# Altium schematic sheet SDR_Power.SchDoc
size B; SheetNumber: 4; SheetTotal: 4
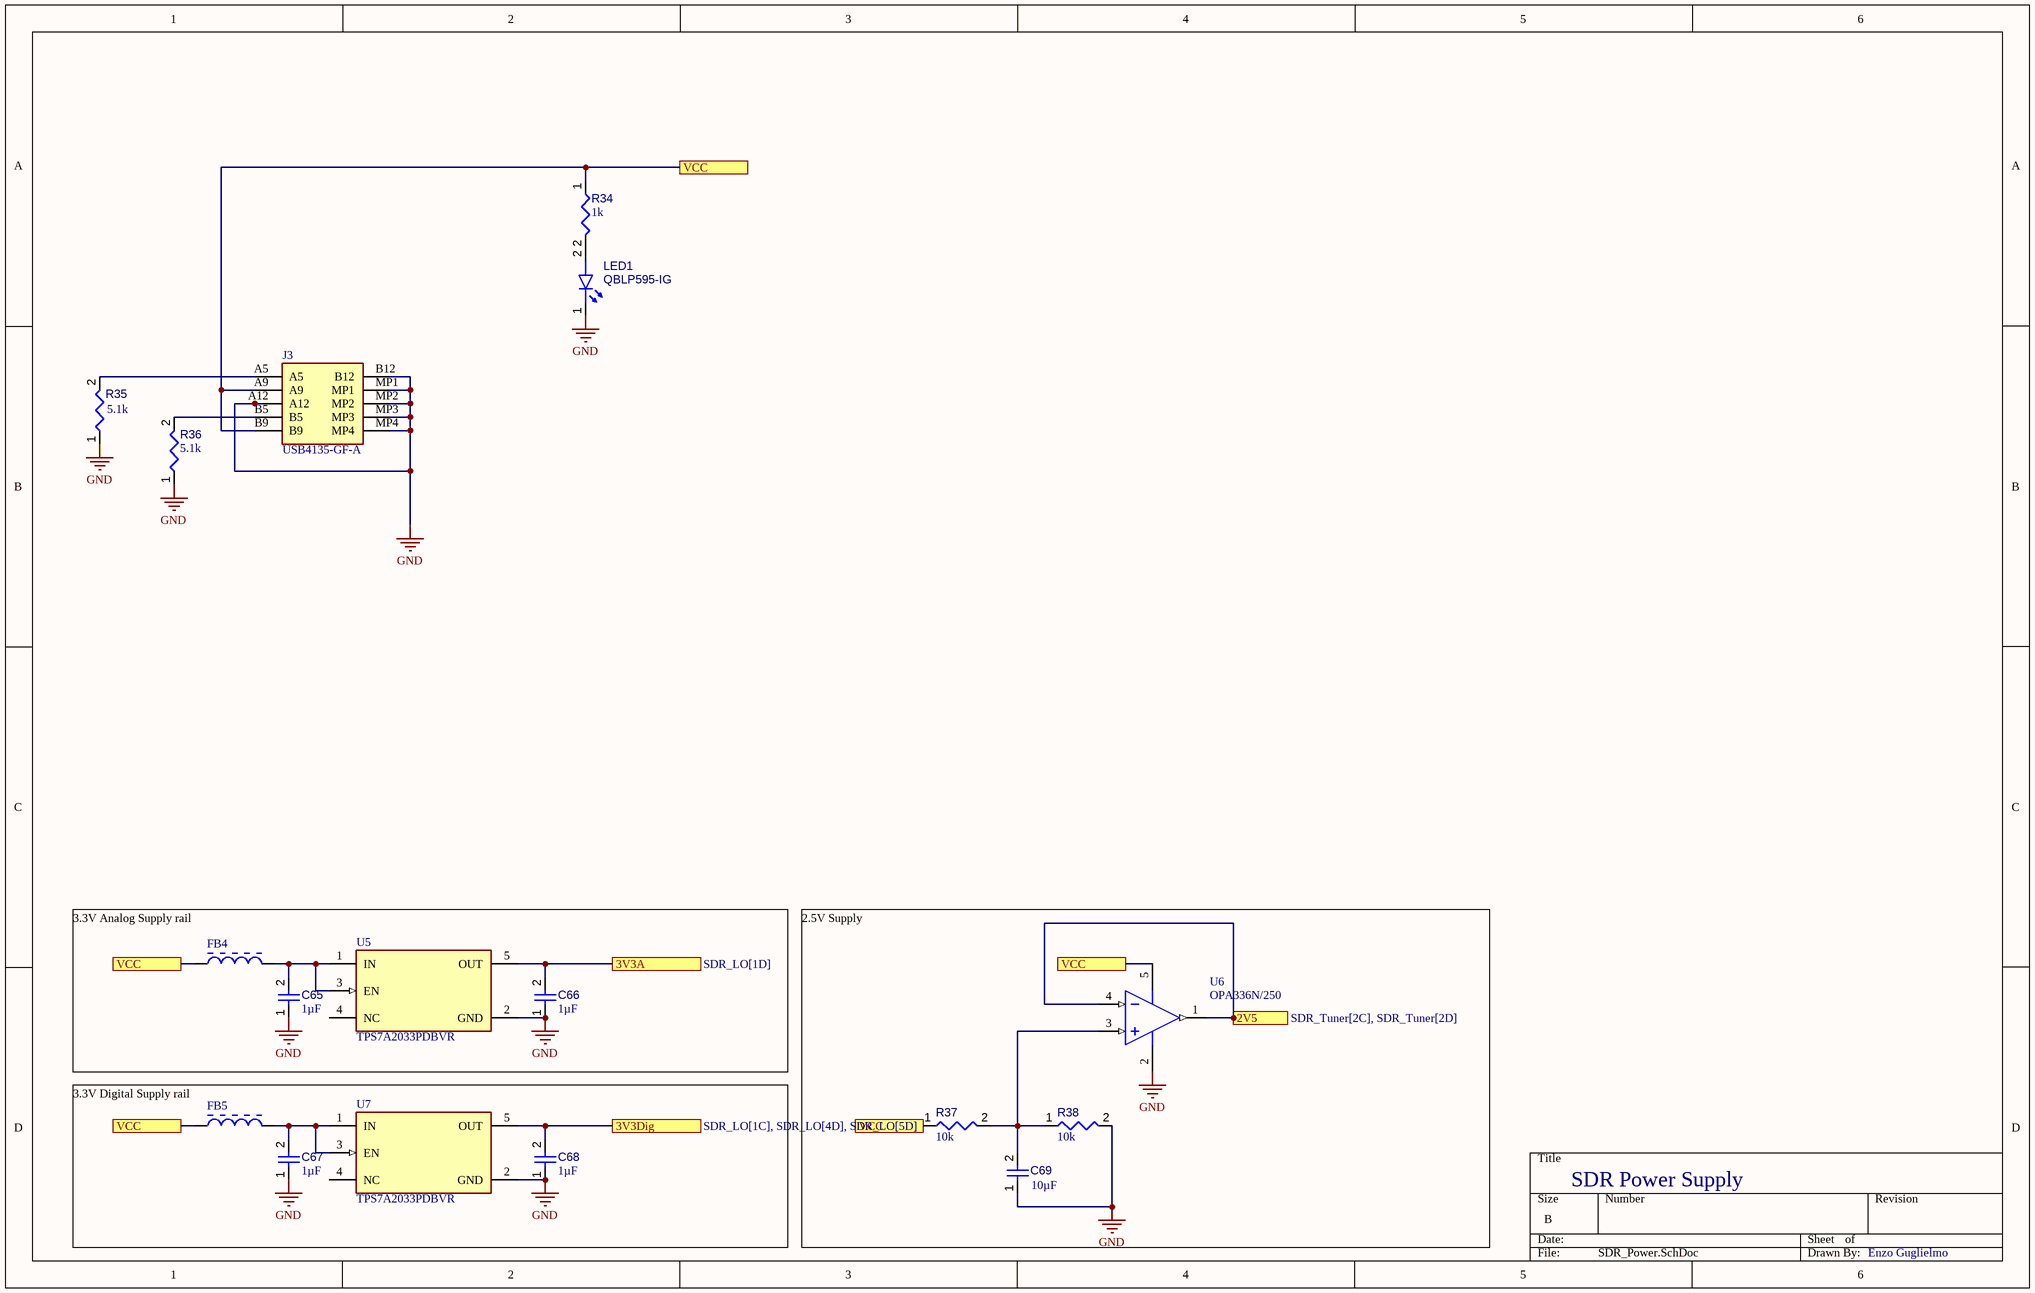
[diagram p0: SDR_Power.SchDoc]

## Parts
C65  value 1µF  [CAPC0402(1005)60_L]  (hidden comment: Capacitor 1µF +/-20% 10V 0402)
C66  value 1µF  [CAPC0402(1005)60_L]  (hidden comment: Capacitor 1µF +/-20% 10V 0402)
C67  value 1µF  [CAPC0402(1005)60_L]  (hidden comment: Capacitor 1µF +/-20% 10V 0402)
C68  value 1µF  [CAPC0402(1005)60_L]  (hidden comment: Capacitor 1µF +/-20% 10V 0402)
C69  value 10µF  [CAPC0402(1005)60_L]  (hidden comment: Capacitor 10µF +/-40% 6.3V 0402)
FB4  BLM21PG331SN1D  [INDC2013X105X50ML20T20]  (value not drawn)
FB5  BLM21PG331SN1D  [INDC2013X105X50ML20T20]  (value not drawn)
J3  USB4135-GF-A  [USB4135GFA]
LED1  QBLP595-IG  [QTB-QBLP595_V]
R34  value 1k  [RESC1005X40X25ML05T05]  (hidden comment: Resistor 100k +/-1% 0402 63 mW)
R35  value 5.1k  [RESC1005X40X25ML05T05]  (hidden comment: Resistor 100k +/-1% 0402 63 mW)
R36  value 5.1k  [RESC1005X40X25ML05T05]  (hidden comment: Resistor 100k +/-1% 0402 63 mW)
R37  value 10k  [RESC0402(1005)_L]  (hidden comment: 10KR2F)
R38  value 10k  [RESC0402(1005)_L]  (hidden comment: 10KR2F)
U5  TPS7A2033PDBVR  [FP-DBV0005A-MFG]
U6  OPA336N/250  [DBV0005A_M]
U7  TPS7A2033PDBVR  [FP-DBV0005A-MFG]

## Ports
2V5 (see SDR_Tuner[2C], SDR_Tuner[2D]), 3V3A (see SDR_LO[1D]), 3V3Dig (see SDR_LO[1C], SDR_LO[4D], SDR_LO[5D]), VCC (see SDR_FrontEnd[1C], SDR_Power[1C], SDR_Power[1D], SDR_Power[3A], SDR_Power[3D], SDR_Tuner[1B]), VCC (see SDR_FrontEnd[1C], SDR_Power[1C], SDR_Power[1D], SDR_Power[3A], SDR_Power[4C], SDR_Tuner[1B]), VCC (see SDR_FrontEnd[1C], SDR_Power[1C], SDR_Power[1D], SDR_Power[3D], SDR_Power[4C], SDR_Tuner[1B]), VCC (see SDR_FrontEnd[1C], SDR_Power[1C], SDR_Power[3A], SDR_Power[3D], SDR_Power[4C], SDR_Tuner[1B]), VCC (see SDR_FrontEnd[1C], SDR_Power[1D], SDR_Power[3A], SDR_Power[3D], SDR_Power[4C], SDR_Tuner[1B])

## Nets
GND: C65.1 C66.1 C67.1 C68.1 C69.1 J3.A12 J3.B12 J3.MP1 J3.MP2 J3.MP3 J3.MP4 LED1.1(K) R35.1 R36.1 R38.2 U5.2(GND) U6.2(V-) U7.2(GND)
2V5: U6.1(OUT) U6.4(IN-) ; port 2V5
3V3A: C66.2 U5.5(OUT) ; port 3V3A
3V3Dig: C68.2 U7.5(OUT) ; port 3V3Dig
VCC: FB4.1 FB5.1 J3.A9 J3.B9 R34.1 R37.1 U6.5(V+) ; port VCC
NetC65_2: C65.2 FB4.2 U5.1(IN) U5.3(EN)
NetC67_2: C67.2 FB5.2 U7.1(IN) U7.3(EN)
NetC69_2: C69.2 R37.2 R38.1 U6.3(IN+)
NetJ3_A5: J3.A5 R35.2
NetJ3_B5: J3.B5 R36.2
NetLED1_2: LED1.2(A) R34.2

Not connected (* = marked no-connect by the designer): U5 4(NC); U7 4(NC)

## Notes on the sheet
- 3.3V Analog Supply rail
- 3.3V Digital Supply rail
- 2.5V Supply
- SDR Power Supply
- Enzo Guglielmo

## Library data of the parts
C65-C68 = CMP-001-00063-3: Chip Capacitor, 1µF +/-20%, 10V, 0402, Thickness 0.6 mm; Tolerance: 10%; Mounting Technology: SMT; Max Operating Temperature: 85°C; Voltage Rating: 10V; Pins: 2; Case/Package: 0402; Min Operating Temperature: -55°C
C69 = CMP-001-00074-3: Chip Capacitor, 10µF +/-40%, 6.3V, 0402, Thickness 0.6 mm; Tolerance: 10%; Case/Package: 0402; Pins: 2; Mounting Technology: SMT; Voltage Rating: 6.3V; Max Operating Temperature: 85°C; Min Operating Temperature: -55°C
FB4 FB5 = CMP-006-00000-3: IND, Chip Ferrite Bead, 330 Ohm, +/- 25%, 1.5 A, -55 to 125 degC, 0805 (2012 Metric), Tape and Reel; Manufacturer: Murata; Current Rating: 1.5A; Impedance: 330Ohm; Resistance: 90mohm; Max Operating Temperature: 125°C; Core Material: Ferrite; Case/Package: 0805; Mounting Technology: SM; Datasheet URL: http://psearch.en.murata.com/inductor/product/LQG15HS15NJ02_.pdf; Packaging: TapeandReel; Min Operating Temperature: -55°C; RoHS Compliant: True; Max Current Rating: 1.5A; Datasheet Version: Nov-11; Package Quantity: 4000; Package Reference: 0805; Package Description: 2-Pin Surface Mount Device, Body 2 x1.25 mm; Tolerance: 25%
J3 = CMP-007-000000-1: USB Connectors USBC Rec GF RA 6P SMT-SMT stakes 3.16mm; Manufacturer_Name: GCT (GLOBAL CONNECTOR TECHNOLOGY); Geometry.Height: 3.5mm; Arrow Part Number: *; Manufacturer_Part_Number: USB4135-GF-A; Design Item ID: USB4135-GF-A; Mouser Price/Stock: https://www.mouser.co.uk/ProductDetail/GCT/USB4135-GF-A?qs=Li%252BoUPsLEnt6HRo6RUvaXA%3D%3D; Arrow Price/Stock: *; Source: USB4135-GF-A.SchLib; Datasheet Link: https://ar.mouser.com/datasheet/2/837/usb4135-2930399.pdf; Mouser Part Number: 640-USB4135-GF-A
LED1 = CMP-007-00041-3: Chip LED 0402, Green, 0.02 A, 3.1 to 3.7 V, -40 to 80 degC, 2-Pin SMD, RoHS, Tape and Reel; Case/Package: 0402; Colour: Green; Mounting Technology: SMT; Pins: 2; RoHS Compliant: Yes
R34-R36 = CMP-009-00021-5: Chip Resistor, 100 KOhm, +/- 1%, 0.063 W, -55 to 155 degC, 0402 (1005 Metric); Voltage Rating: 50V; Power: 63mW; Pins: 2; Tolerance: 1%; Max Operating Temperature: 155°C; Case/Package: 0402; Min Operating Temperature: -55°C; Mounting Technology: SM; RoHS Compliant: True
R37 R38 = CMP-009-00066-2: 10K 0.063W 1% 0402 (1005 Metric)  SMD; Power: 63mW; Case/Package: 0402; Mounting Technology: SMT; Pins: 2; Tolerance: 1%
U5 U7 = CMP-04917-000300-1: IC REG LINEAR 3.3V 300MA SOT23-5; RoHS Compliant: Yes
U6 = CMP-014-00020-2: Single-Supply, MicroPower CMOS Operational Amplifier, 2.3 to 5.5 V, -55 to 125 degC, 5-Pin SOT23 (DBV5), Green (RoHS & no Sb/Br), Tape and Reel; Manufacturer: Texas Instruments (TI); Max Supply Voltage: 5V; Unity Gain Bandwidth Product: 100KHz; Slew Rate: 0.03V/us; Nominal Gain Bandwith Product: 11MHz; Common Mode Rejection Ratio: 80dB; Channels: 1; Max I/O Voltage: 125uV; Min Supply Voltage: 3V; Nominal Voltage Gain: 115dB; Nominal Supply Current: 32uA; Package Quantity: 250; Package Reference: DBV0005A; Datasheet URL: http://www.ti.com/general/docs/lit/getliterature.tsp?genericPartNumber=OPA336&fileType=pdf; Package Description: 5-Pin Small Outline Transistor, Body 2.9 x 1.6 mm, Pitch 0.95 mm; Datasheet Version: SBOS068C, 01/2005; Min Operating Temperature: -40°C; Package URL: http://www.ti.com/lit/ml/mpds018l/mpds018l.pdf; RoHS Compliant: True; Case/Package: SOT-23-5; Mounting Technology: SM; Pins: 5; Max Operating Temperature: 85°C; Packaging: TapeandReel; Manufacturer URL: http://www.ti.com/